# Altium schematic sheet 背景抑制新版手抄.SchDoc
size A3
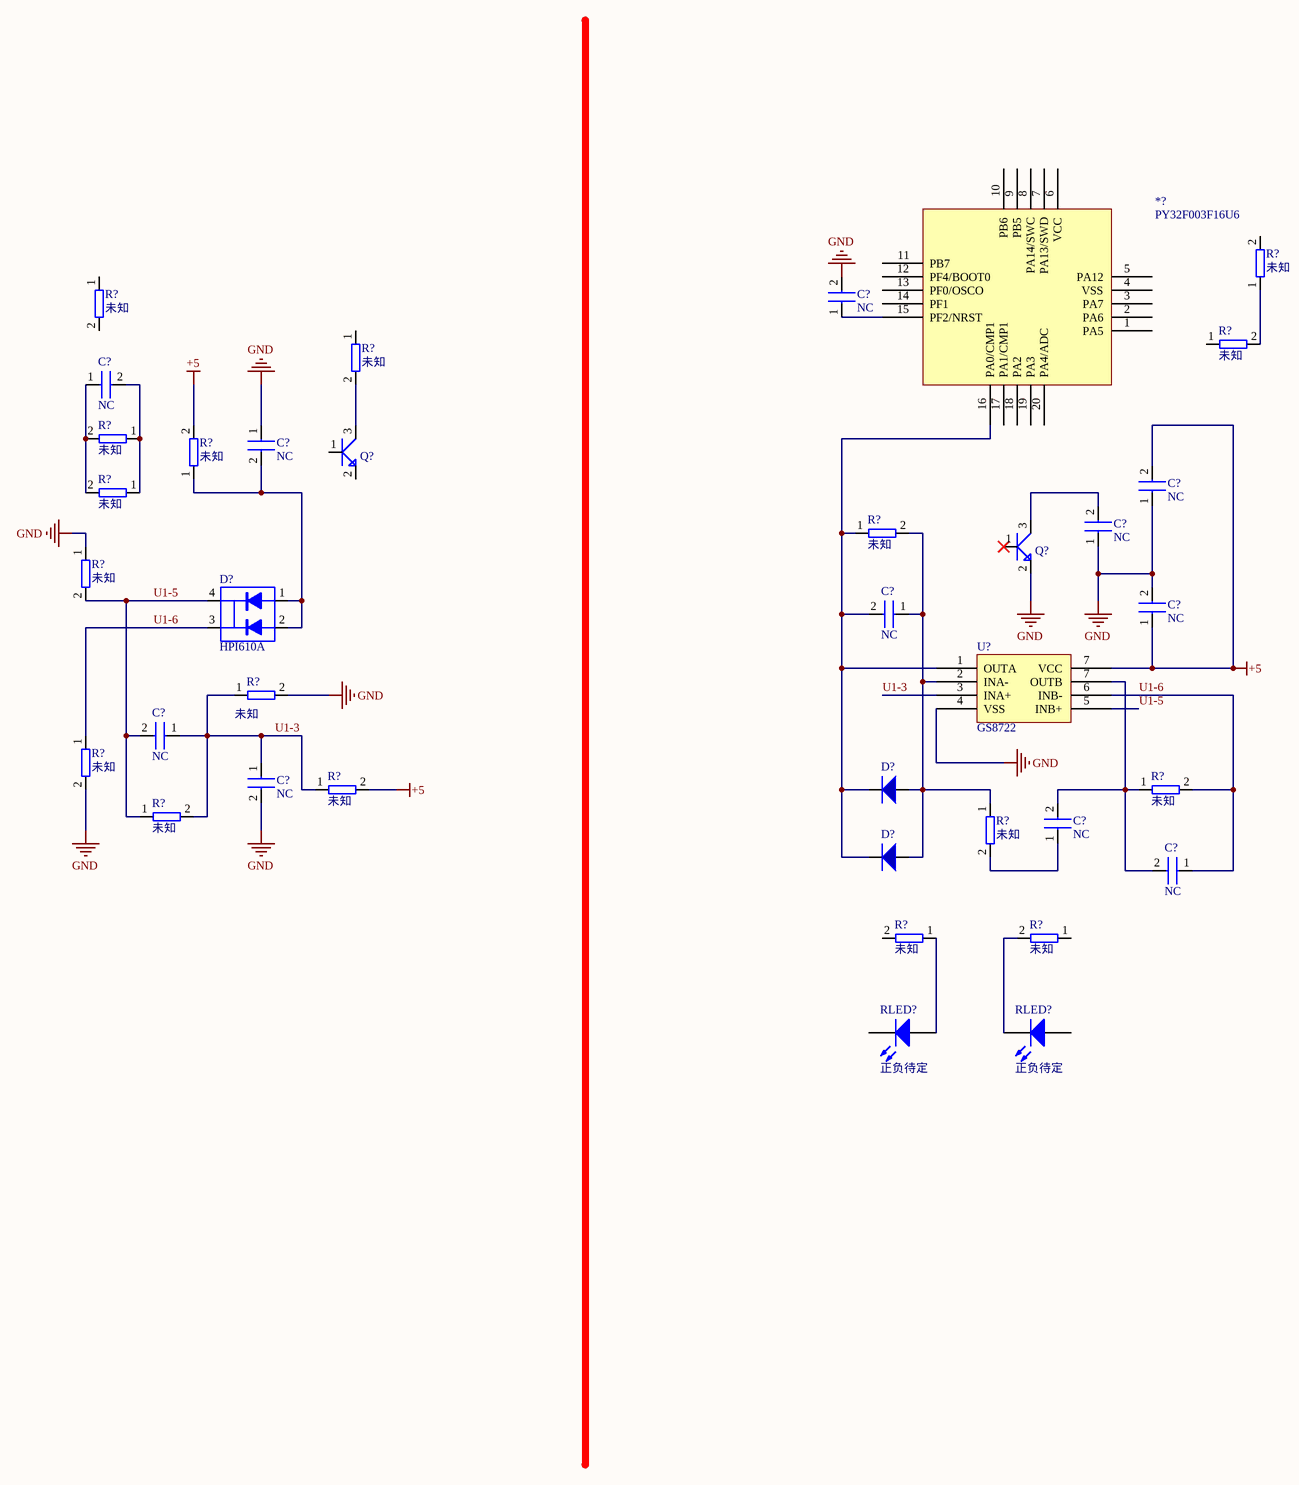
[diagram p0: 背景抑制新版手抄.SchDoc]

## Parts
(Parts that share a designator on the sheet are numbered #1, #2 ... from top to bottom, then left to right.)
*?  PY32F003F16U6
C?#1  NC
C?#2  NC
C?#3  NC
C?#4  NC
C?#5  NC
C?#6  NC
C?#7  NC
C?#8  NC
C?#9  NC
C?#10  NC
C?#11  NC
D?#1  HPI610A  [SMD-4]
D?#2  (no value)
D?#3  (no value)
Q?#1  2SC4617TLR  (value not drawn)
Q?#2  2SC4617TLR  (value not drawn)
R?#1  未知
R?#2  未知
R?#3  未知
R?#4  未知
R?#5  未知
R?#6  未知
R?#7  未知
R?#8  未知
R?#9  未知
R?#10  未知
R?#11  未知
R?#12  未知
R?#13  未知
R?#14  未知
R?#15  未知
R?#16  未知
R?#17  未知
RLED?#1  正负待定  [LED-0]
RLED?#2  正负待定  [LED-0]
U?  GS8722

## Nets
+5: C?#4.2 C?#7.1 R?#6.2 R?#12.2 U?.7(VCC)
GND: C?#1.2 C?#3.1 C?#4.1 C?#5.1 C?#7.2 C?#9.2 Q?#2.2(E) R?#9.1 R?#10.2 R?#11.2 U?.4(VSS)
U1-3: C?#8.1 C?#9.1 R?#10.1 R?#12.1 R?#15.2 U?.3(INA+)
U1-5: C?#8.2 D?#1.4 R?#9.2 R?#15.1 U?.5(INB+)
U1-6: C?#11.1 D?#1.3 R?#11.1 R?#13.2 U?.6(INB-)
Net*?_15: *?.15(PF2/NRST) C?#1.1
Net*?_16: *?.16(PA0/CMP1) C?#6.2 D?#2.2 D?#3.2 R?#8.1 U?.1(OUTA)
NetC?#2_1: C?#2.1 R?#5.2 R?#7.2
NetC?#2_2: C?#2.2 R?#5.1 R?#7.1
NetC?#3_2: C?#3.2 D?#1.1 D?#1.2 R?#6.1
NetC?#5_2: C?#5.2 Q?#2.3(C)
NetC?#6_1: C?#6.1 D?#2.1 D?#3.1 R?#8.2 R?#14.1 U?.2(INA-)
NetC?#10_1: C?#10.1 R?#14.2
NetC?#10_2: C?#10.2 C?#11.2 R?#13.1 U?.7(OUTB)
NetQ?#1_3: Q?#1.3(C) R?#3.2
NetR?#2_1: R?#2.1 R?#4.2
NetR?#16_1: R?#16.1 RLED?#1.1(A)
NetR?#17_2: R?#17.2 RLED?#2.2(K)

Not connected (* = marked no-connect by the designer): *? 1(PA5) 2(PA6) 3(PA7) 4(VSS) 5(PA12) 6(VCC) 7(PA13/SWD) 8(PA14/SWC) 9(PB5) 10(PB6) 11(PB7) 12(PF4/BOOT0) 13(PF0/OSCO) 14(PF1) 17(PA1/CMP1) 18(PA2) 19(PA3) 20(PA4/ADC); Q?#1 1(B) 2(E); Q?#2 1(B)*; R?#1 1 2; R?#2 2; R?#3 1; R?#4 1; R?#16 2; R?#17 1; RLED?#1 2(K); RLED?#2 1(A)

## Library data of the parts
C?#1-C?#11 = CAP
D?#1 = DIODE4A.
D?#2 D?#3 = D
Q?#1 Q?#2 = 2SC4617
R?#1-R?#17 = RES
RLED?#1 RLED?#2 = LED0: Typical INFRARED GaAs LED; Published: 8-Jun-2000; LatestRevisionDate: 08-Jul-2005; LatestRevisionNote: Mech Layer 1 removed.; PackageReference: LED-0; Publisher: Altium Limited; PackageDescription: LED; 2 Leads
U? = GS358